# Altium schematic sheet ChristmasTreeLEDSchDoc.SchDoc
size A1; SheetNumber: 1; SheetTotal: 1
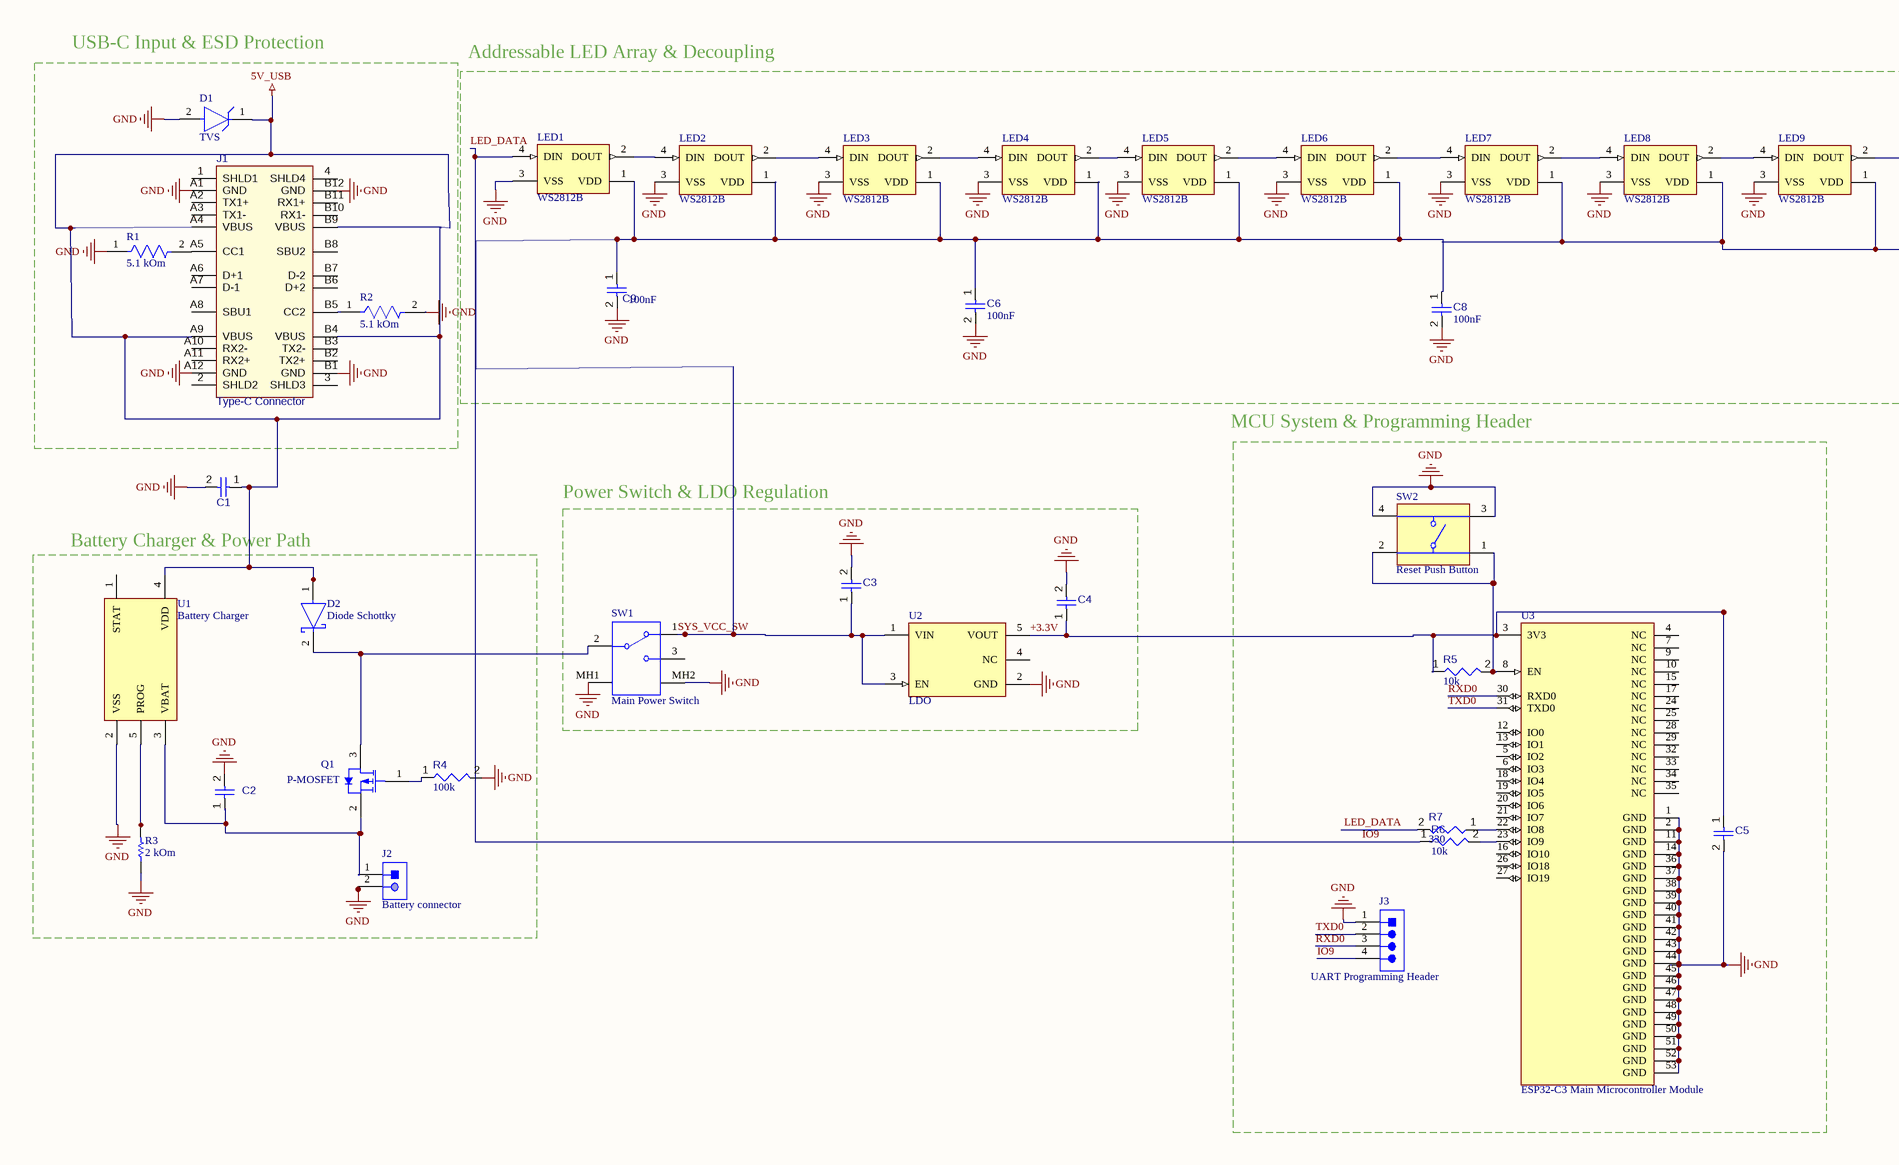
[diagram p0: ChristmasTreeLEDSchDoc.SchDoc, left]
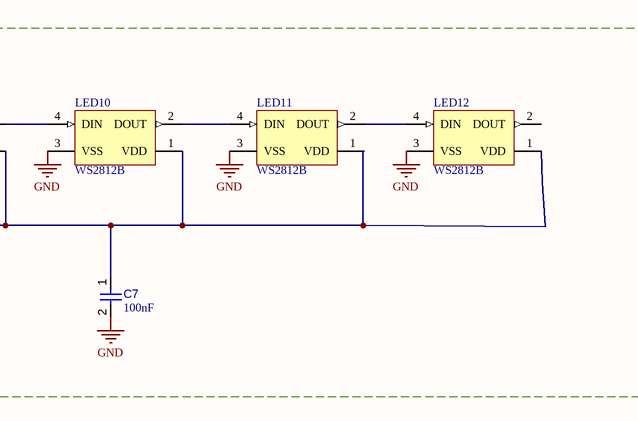
[diagram p1: ChristmasTreeLEDSchDoc.SchDoc, right]

## Parts
C1  Capacitor 470nF +/-20% 25V 0603  [CAPC0603(1608)100_L]  (value not drawn)
C2  Capacitor 470nF +/-20% 25V 0603  [CAPC0603(1608)100_L]  (value not drawn)
C3  Capacitor 470nF +/-20% 25V 0603  [CAPC0603(1608)100_L]  (value not drawn)
C4  Capacitor 470nF +/-20% 25V 0603  [CAPC0603(1608)100_L]  (value not drawn)
C5  Capacitor 470nF +/-20% 25V 0603  [CAPC0603(1608)100_L]  (value not drawn)
C6  value 100nF  [CAPC2013X95X50LL10T25]  (hidden comment: Capacitor 100 nF +/-10% 50 V 0805)
C7  value 100nF  [CAPC2013X95X50LL10T25]  (hidden comment: Capacitor 100 nF +/-10% 50 V 0805)
C8  value 100nF  [CAPC2013X95X50LL10T25]  (hidden comment: Capacitor 100 nF +/-10% 50 V 0805)
C9  value 100nF  [CAPC2013X95X50LL10T25]  (hidden comment: Capacitor 100 nF +/-10% 50 V 0805)
D1  TVS  [FP-SMBJ-MFG]
D2  Diode Schottky  [FP-403AE-MFG]
J1  Type-C Connector  [JAE-DX07S024JJ3_V]
J2  Battery connector  [JST-S2B-XH-A(LF)(SN)_V]
J3  UART Programming Header  [JST-S4B-XH-A(LF)(SN)_V]
LED1  WS2812B  [ADAI-WS2812B_V]
LED2  WS2812B  [ADAI-WS2812B_V]
LED3  WS2812B  [ADAI-WS2812B_V]
LED4  WS2812B  [ADAI-WS2812B_V]
LED5  WS2812B  [ADAI-WS2812B_V]
LED6  WS2812B  [ADAI-WS2812B_V]
LED7  WS2812B  [ADAI-WS2812B_V]
LED8  WS2812B  [ADAI-WS2812B_V]
LED9  WS2812B  [ADAI-WS2812B_V]
LED10  WS2812B  [ADAI-WS2812B_V]
LED11  WS2812B  [ADAI-WS2812B_V]
LED12  WS2812B  [ADAI-WS2812B_V]
Q1  P-MOSFET  [AO-SOT-23-3L_V]
R1  5.1 kOm  [FP-MCR03-IPC_B]
R2  5.1 kOm  [FP-MCR03-IPC_B]
R3  2 kOm  [RESC1609X50X30LL10T20]
R4  value 100k  [RESC2013X70X40ML20T20]  (hidden comment: Resistor 100k +/-1% 0805 125 mW)
R5  value 10k  [RESC2013X50X35ML15T15]  (hidden comment: Resistor 10k +/-1% 0805 125 mW)
R6  value 10k  [RESC2013X50X35ML15T15]  (hidden comment: Resistor 10k +/-1% 0805 125 mW)
R7  value 330  [RESC0402(1005)_L]  (hidden comment: Resistor 330R +/-5 % 0402 63 mW)
SW1  Main Power Switch  [TECO-1825255-1_V]
SW2  Reset Push Button  [BEST-TS-1109_V]
U1  Battery Charger  [FP-C04-091-OT-IPC_B]
U2  LDO  [FP-SOT25-IPC_A]
U3  ESP32-C3 Main Microcontroller Module  [FP-ESP32-C3-MINI-1-H4-MFG]

## Blocks framed on the sheet
USB-C Input & ESD Protection: D1 J1 R1 R2
Addressable LED Array & Decoupling: C6-C9 LED1-LED12
MCU System & Programming Header: C5 J3 R5-R7 SW2 U3
Power Switch & LDO Regulation: C3 C4 SW1 U2
Battery Charger & Power Path: C2 D2 J2 Q1 R3 R4 U1

## Nets
5V_USB: C1.1 D1.1(C) D2.1(A) J1.A4(VBUS) J1.A9(VBUS) J1.B4(VBUS) J1.B9(VBUS) U1.4(VDD)
GND: C1.2 C2.2 C3.2 C4.2 C5.2 C6.2 C7.2 C8.2 C9.2 D1.2(A) J1.A1(GND) J1.A12(GND) J1.B1(GND) J1.B12(GND) J2.2 J3.1 LED1.3(VSS) LED2.3(VSS) LED3.3(VSS) LED4.3(VSS) LED5.3(VSS) LED6.3(VSS) LED7.3(VSS) LED8.3(VSS) LED9.3(VSS) LED10.3(VSS) LED11.3(VSS) LED12.3(VSS) R1.1 R2.2 R3.1 R4.2 SW1.MH1 SW1.MH2 SW2.3 SW2.4 U1.2(VSS) U2.2(GND) U3.1(GND) U3.2(GND) U3.11(GND) U3.14(GND) U3.36(GND) U3.37(GND) U3.38(GND) U3.39(GND) U3.40(GND) U3.41(GND) U3.42(GND) U3.43(GND) U3.44(GND) U3.45(GND) U3.46(GND) U3.47(GND) U3.48(GND) U3.49(GND) U3.50(GND) U3.51(GND) U3.52(GND) U3.53(GND)
 LED_DATA: J3.4 LED1.4(DIN) R6.1 R7.2  [also labelled IO9, LED_DATA]
+3.3V: C4.1 C5.1 R5.1 U2.5(VOUT) U3.3(3V3)
RXD0: J3.3 U3.30(RXD0)
SYS_VCC_SW: C3.1 C6.1 C8.1 C9.1 LED1.1(VDD) LED2.1(VDD) LED3.1(VDD) LED4.1(VDD) LED5.1(VDD) LED6.1(VDD) SW1.1 U2.1(VIN) U2.3(EN)
TXD0: J3.2 U3.31(TXD0)
NetC2_1: C2.1 J2.1 Q1.2(SOURCE) U1.3(VBAT)
NetC7_1: C7.1 LED7.1(VDD) LED8.1(VDD) LED9.1(VDD) LED10.1(VDD) LED11.1(VDD) LED12.1(VDD)
NetD2_2: D2.2(C) Q1.3(DRAIN) SW1.2
NetJ1_A5: J1.A5(CC1) R1.2
NetJ1_B5: J1.B5(CC2) R2.1
NetLED1_2: LED1.2(DOUT) LED2.4(DIN)
NetLED2_2: LED2.2(DOUT) LED3.4(DIN)
NetLED3_2: LED3.2(DOUT) LED4.4(DIN)
NetLED4_2: LED4.2(DOUT) LED5.4(DIN)
NetLED5_2: LED5.2(DOUT) LED6.4(DIN)
NetLED6_2: LED6.2(DOUT) LED7.4(DIN)
NetLED7_2: LED7.2(DOUT) LED8.4(DIN)
NetLED8_2: LED8.2(DOUT) LED9.4(DIN)
NetLED9_2: LED9.2(DOUT) LED10.4(DIN)
NetLED10_2: LED10.2(DOUT) LED11.4(DIN)
NetLED11_2: LED11.2(DOUT) LED12.4(DIN)
NetQ1_1: Q1.1(GATE) R4.1
NetR3_2: R3.2 U1.5(PROG)
NetR5_2: R5.2 SW2.1 SW2.2 U3.8(EN)
NetR6_2: R6.2 U3.23(IO9)
NetR7_1: R7.1 U3.22(IO8)

Not connected (* = marked no-connect by the designer): J1 1(SHLD1) 2(SHLD2) 3(SHLD3) 4(SHLD4) A2(TX1+) A3(TX1-) A6(D+1) A7(D-1) A8(SBU1) A10(RX2-) A11(RX2+) B2(TX2+) B3(TX2-) B6(D+2) B7(D-2) B8(SBU2) B10(RX1-) B11(RX1+); LED12 2(DOUT); SW1 3; U1 1(STAT); U2 4(NC); U3 4(NC) 5(IO2) 6(IO3) 7(NC) 9(NC) 10(NC) 12(IO0) 13(IO1) 15(NC) 16(IO10) 17(NC) 18(IO4) 19(IO5) 20(IO6) 21(IO7) 24(NC) 25(NC) 26(IO18) 27(IO19) 28(NC) 29(NC) 32(NC) 33(NC) 34(NC) 35(NC)

## Library data of the parts
C1-C5 = CMP-001-00077-3: Chip Capacitor, 470nF +/-20%, 25V, 0603, Thickness 1 mm; Tolerance: 10%; Mounting Technology: SMT; Case/Package: 0603; Pins: 2; Min Operating Temperature: -55°C; Max Operating Temperature: 85°C; Voltage Rating: 25V; Value: 470nF
C6-C9 = CMP-001-00018-6: Chip Capacitor, 100 nF, +/- 10%, 50 V, 0805 (2012 Metric); Capacitor Type: Ceramic; Voltage Rating: 50V; Pins: 2; Max Operating Temperature: 125°C; Min Operating Temperature: -55°C; Mounting Technology: SM; Case/Package: 0805; RoHS Compliant: True; Tolerance: 10%
D1 = CMP-07401-000003-1: TVS DIODE 5V 9.2V SMB; Manufacturer: Bourns Inc.; Manufacturer Part Number: SMBJ5.0A; Number Of Channels: 1; Breakdown Voltage: 6.4V; Peak Pulse Power: 600W; Peak Pulse Current: 65.3A; Max Junction Temp: +150°C; Standoff Height: 0.05mm; Direction: Unidirectional; RoHS: TRUE; Device Class L3: unset; Height: 2.44mm; Package: SMBJ; Lead Free: Yes; Category: Diode; Device Class L1: Circuit Protection; Octopart: https://octopart.com/smbj5.0a-bourns-12809487; Reverse Standoff Voltage: 5V; Device Class L2: TVS Diodes; Temperature Range Low: -55°C; Automotive: No; Clamping Voltage: 9.2V; ComponentLink2URL: https://www.bourns.com/docs/Product-Datasheets/SMBJ.pdf; ComponentLink2Description: Datasheet; Temperature Range High: +150°C; Digikey Description: TVS DIODE 5V 9.2V SMB; Temperature: -55°C to +150°C; Mouser Description: Dio Tvs Vwm 5.0V 600W Unidir Smb Rohs Compliant: Yes
D2 = CMP-2000-04943-2: DIODE SCHOTTKY 40V 1A SMA; Manufacturer Part Number: SS14; Manufacturer: ON Semiconductor; Peak Reverse Current: 0.2mA; Max Junction Temp: +125°C; Standoff Height: 0.05mm; Max Surge Forward Current: 40A; Mouser Description: Schottky Diodes & Rectifiers SMA 40V 1.0A; RoHS: TRUE; Lead Free: Yes; Device Class L3: Schottky Diodes; Category: Diode; Automotive: No; Digikey Description: DIODE SCHOTTKY 40V 1A SMA; ComponentLink2Description: Datasheet; Device Class L2: Diodes; Height: 2.5mm; Temperature Range High: +125°C; ComponentLink2URL: https://www.onsemi.com/pub/Collateral/SS19-D.PDF; Device Class L1: Discrete Semiconductors; Package: 403AE; Octopart: https://octopart.com/ss14-on+semiconductor-29205033; Max Repetitive Reverse Voltage: 40V; Temperature Range Low: -65°C; Forward Current: 1A; Temperature: -65°C to +125°C
J1 = CMP-002-00065-3: USB-C Connector, 20 V, 1.25 A, -30 to 80 degC, RoHS, Tape and Reel; Gender: Receptacle; Pins: 28; Connector Type: USB-C
J2 = CMP-002-00032-2: Male Header, Pitch 2.5 mm, 1 x 2 Position, Height 6.1 mm, Tail Length 3.4 mm, -25 to 85 degC, RoHS, Bulk; Manufacturer: JST; Case/Package: S2B-XH-A(LF)(SN); Package Description: XH Series Disconnectable Crimp Style Connector, Pitch 2.5 mm, 1 x 2 Position, Height 6.1 mm, Tail Length 3.4 mm; Manufacturer URL: http://www.jst.com/home2.html; Datasheet URL: http://www.jst-mfg.com/product/pdf/eng/eXH.pdf; Connector Type: Header; Package Reference: S2B-XH-A(LF)(SN); Mounting Technology: TH; Max Operating Temperature: 85°C; Min Operating Temperature: -25°C; Datasheet Version: May-16; Gender: Male; RoHS Compliant: Unknown
J3 = CMP-002-00034-2: Male Header, Pitch 2.5 mm, 1 x 4 Position, Height 6.1 mm, Tail Length 3.4 mm, -25 to 85 degC, RoHS, Bulk; Manufacturer: JST; Manufacturer URL: http://www.jst.com/home2.html; RoHS Compliant: Unknown; Gender: Male; Min Operating Temperature: -25°C; Datasheet URL: http://www.jst-mfg.com/product/pdf/eng/eXH.pdf; Case/Package: S4B-XH-A(LF)(SN); Datasheet Version: May-16; Mounting Technology: TH; Package Reference: S4B-XH-A(LF)(SN); Max Operating Temperature: 85°C; Package Description: XH Series Disconnectable Crimp Style Connector, Pitch 2.5 mm, 1 x 4 Position, Height 6.1 mm, Tail Length 3.4 mm; Connector Type: Header
LED1-LED12 = CMP-007-00035-2: Intelligent Control LED Integrated Light Source, 3.5 to 5.3 V, -25 to 80 degC, 4-Pin SMD, RoHS, Bulk; Manufacturer: Adafruit Industries; Datasheet URL: https://cdn-shop.adafruit.com/datasheets/WS2812B.pdf; Manufacturer URL: https://www.adafruit.com/; Datasheet Version: May-13; Case/Package: WS2812B; Mounting Technology: SM; RoHS Compliant: False; Package Description: 4-Pin Surface Mount Device, Body 5 x 5 mm, Pitch 3.3 mm; Package Reference: WS2812B
Q1 = CMP-2000-05778-1: P-Channel MOSFET, 30 V, 4 A, -55 to 150 degC, 3-Pin SOT-23-3L, RoHS, Tape and Reel; Manufacturer: Alpha and Omega; Output Power (Max): NotRequiredW; Power Dissipation: 1.4W; Rad Hardened: No; Drain Efficiency: NotRequired%; Drain-Source On-Volt: 30V; Noise Figure: NotRequireddB; Frequency (Max): NotRequiredMHz; Number of  Elements: 1; Gate-Source Voltage (Max): ?12V; Drain Current (Max): 4A; Channel Mode: Enhancement; Drain-Source On-Res: 0.044ohm; Type: PowerMOSFET; Polarity: P; Package URL: http://www.aosmd.com/res/packaging_information/SOT-23-3L.pdf; Datasheet URL: http://www.aosmd.com/res/data_sheets/AO3401A.pdf; Package Type: SOT-23; Package Description: 3-Pin Small Outline Transistor, Body 2.95 x 1.6 mm, Pitch 0.95 mm; Mounting: SurfaceMount; Manufacturer URL: http://www.aosmd.com/; Continuous Drain Current: 4A; Package Reference: SOT-23-3L; Mounting Technology: SurfaceMount; Operating Temperature Classification: Military; Power Gain: NotRequireddB; Datasheet Version: Rev. 3, 03/2011; Operating Temp Range: -55Cto150C; Pin Count: 3
R1 R2 = CMP-08839-027005-1: Thick Film Chip Resistor, 0603, 5.1kΩ, 5%, 200ppm/°C, 0.1W, 50V; Resistance: 5.1kR; Max Power Dissipation: 100mW; Value: 5.1kR; Width: 0.031inch; Case Code (Imperial): 0603; Features: Automotive AEC-Q200; Voltage Rating (DC): 50V; Package Quantity: 5000; Number of Terminations: 2; Min Operating Temperature: -55°C; Resistor Type: Thick Film; Max Operating Temperature: 155°C; Contact Plating: Tin; Working Voltage: 50V; Technology: THICK FILM; Height: 0.022inch; Power Rating: 100mW; Lead Free: Lead Free; Temperature Coefficient: 200ppm/°C; Series: MCR; Length: 0.063inch; Tolerance: 5%; Case Code (Metric): 1608; Case/Package: 0603; Mount: Surface Mount; RoHS Compliant: Yes; Packaging: Tape and Reel
R3 = CMP-2000-03162-1: Manufacturer: Vishay Dale; Part Number: CRCW06032K00FKTA
R4 = CMP-009-00024-5: Chip Resistor, 100 KOhm, +/- 1%, 0.125 W, -55 to 155 degC, 0805 (2012 Metric); Power: 125mW; Voltage Rating: 150V; Max Operating Temperature: 155°C; Mounting Technology: SM; RoHS Compliant: True; Tolerance: 1%; Case/Package: 0805; Min Operating Temperature: -55°C; Pins: 2
R5 R6 = CMP-009-00018-5: Chip Resistor, 10 KOhm, +/- 1%, 125 mW, -55 to 155 degC, 0805 (2012 Metric); Power: 125mW; Voltage Rating: 150V; Tolerance: 1%; Pins: 2; Min Operating Temperature: -55°C; Case/Package: 0805; Max Operating Temperature: 155°C; RoHS Compliant: True; Mounting Technology: SM
R7 = CMP-009-00132-3: Chip Resistor, 330 Ohms, +/-5 %, 63 mW, -55 to 155 degC, 0402; Power: 63mW; Tolerance: 5%; Pins: 2; Max Operating Temperature: 155°C; Min Operating Temperature: -55°C; Case/Package: 0402
SW1 = CMP-011-00001-2: Slide Switch, SPDT, 0.3A, 125 V, -20 to 85 degC, 5-Pin THD, RoHS, Tray; Manufacturer: TE Connectivity; Current Rating: 300mA; Voltage Rating (AC): 125V; Max Contact Resistance: 30mohm; Operating Force: 600gf; Manufacturer URL: http://www.te.com/; Max Current Rating: 300mA; Contact Plating: Silver; Contact Material: Copper; Datasheet URL: http://www.te.com/commerce/DocumentDelivery/DDEController?Action=showdoc&DocId=Customer+Drawing%7F1825255%7FA4%7Fpdf%7FEnglish%7FENG_CD_1825255_A4_baseFilename.pdf%7F1825255-1; Throw Configuration: SPDT; Packaging: Bulk; Package Quantity: 560; Max Voltage Rating (AC): 125V; Mounting Technology: TH; RoHS Compliant: True; Case/Package: 1825255-1; Datasheet Version: Rev. A4, 03/2014; Contact Finish: Silver; Package Reference: 1825255-1; Package Description: 5-Pin Through Hole Device, Body 6.7 x 16 mm, Pitch 4 mm; Min Operating Temperature: -20°C; Max Operating Temperature: 85°C
SW2 = CMP-011-00002-2: Tactile Switch, SPST, 12 V, 50 mA, -20 to 80 degC, 4-Pin THD; Manufacturer: Shenzhen Best; RoHS Compliant: Unknown; Manufacturer URL: www.best-dz.com/; Case/Package: TS-1109; Package Reference: TS-1109; Datasheet Version: Dec-12; Mounting Technology: TH; Package Description: 4-Pin Through Hole Device, Body 6.2 x 6.2 mm; Datasheet URL: http://datasheet.octopart.com/TS-1109-Best-Inc.-datasheet-30458100.pdf
U1 = CMP-0133-00143-2: IC CONTROLLR LI-ION 4.2V SOT23-5; Max Power Dissipation: 1.54W; Output Current: 500mA; Max Output Voltage: 4.5V; Number of Outputs: 1; Min Output Voltage: 4.168V; Min Supply Voltage: 3.75V; Max Input Voltage: 6V; Voltage Rating: 4.534V; Drain to Source Resistance: 350mR; Max Operating Temperature: 85°C; Length: 0.122inch; Number of Pins: 5; REACH SVHC: No SVHC; Radiation Hardening: No; Min Operating Temperature: -40°C; Weight: 0.00709oz; Contact Plating: Tin; Termination: SMD/SMT; Case/Package: SOT-23; Mount: Surface Mount; Width: 0.071inch; Packaging: Tape and Reel; Number of Cells: 1; Max Charge Current: 500mA; Height: 0.051inch; Number of Channels: 1; Output Voltage: 4.2V; Max Supply Voltage: 6V; Lead Free: Lead Free
U2 = CMP-12756-000035-1: IC REG LINEAR 3.3V 600MA SOT25; Number of Regulators: 1; Output Type: Fixed; Polarity: Positive; Min Input Voltage: 2.5V; Max Input Voltage: 6V; Accuracy: 1.5%; Quiescent Current: 55uA; Dropout Voltage: 250mV; Min Operating Temperature: -40°C; Length: 3.1mm; Output Current: 600mA; Max Operating Temperature: 85°C; Package Quantity: 1; Output Voltage: 3.3V; Width: 1.7mm; Number of Outputs: 1; Packaging: Tape and Reel; Height: 1.3mm; Lead Free: Lead Free; Max Output Current: 600mA; Case/Package: SOT-23-5; Mount: Surface Mount; Number of Pins: 5
U3 = CMP-10700-116589974-1: Multiprotocol Modules SMD module, ESP32-C3FH4, PCB antenna, -40 C +105 C; Data Rate: 150Mbps; Number of GPIO: 13; Current - Transmitting: 350mA; Max Frequency: 2.484GHz; Current - Receiving: 84mA; Max Supply Voltage: 3.6V; Min Supply Voltage: 3V; Interface: SPI; Min Operating Temperature: -40°C; Height: 2.55mm; Ambient Temperature Range High: 85°C; Max Operating Temperature: 85°C